# Altium project Robot Sensor Module.PrjPcb
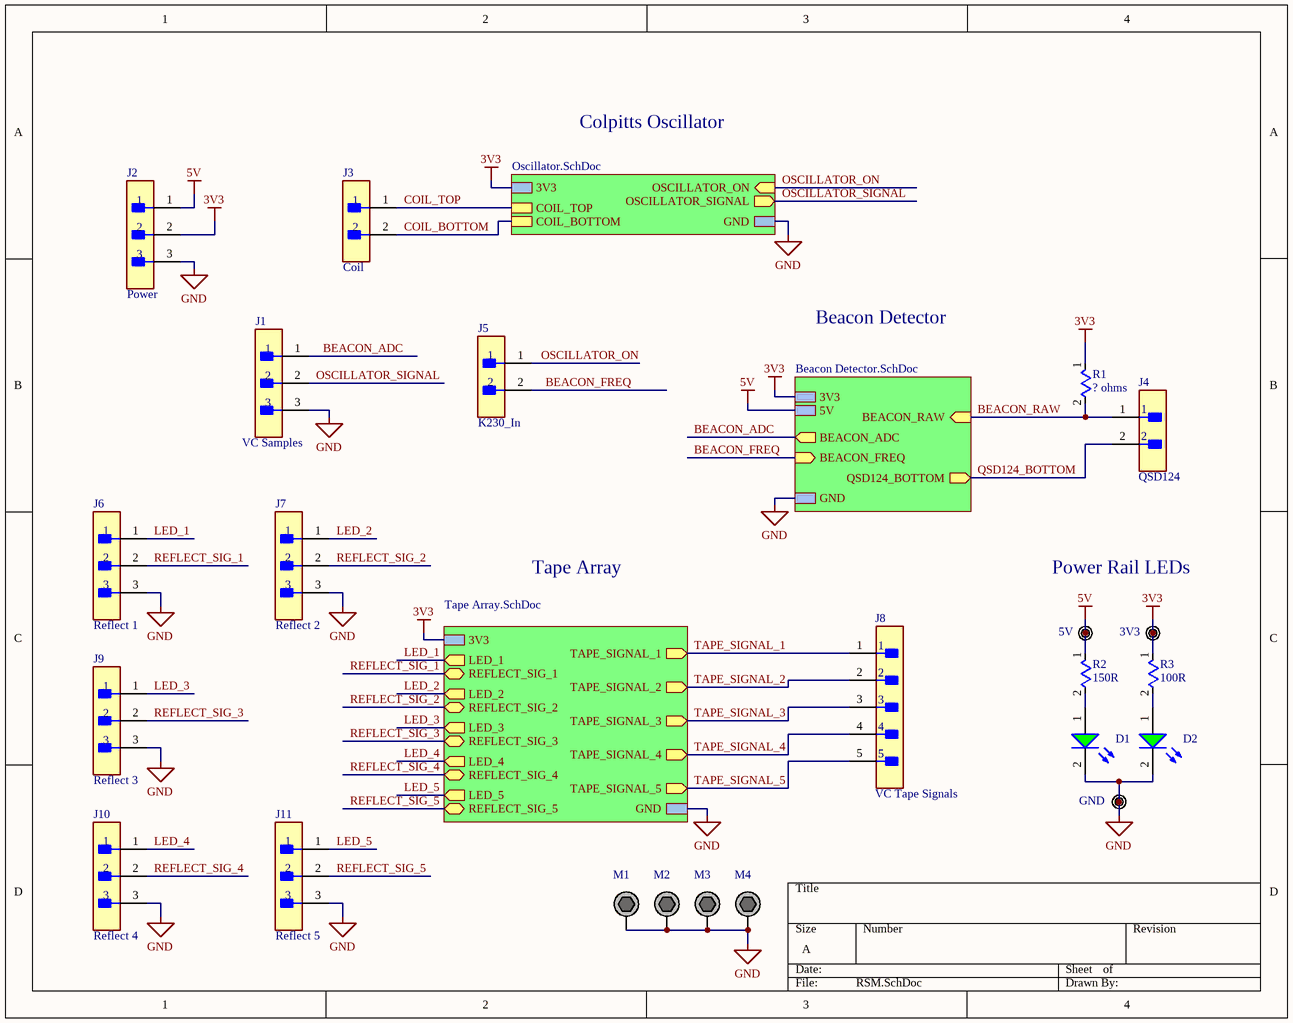
[diagram p0: RSM.SchDoc]
4 sheets, 74 parts. Net scope: hierarchical (ports join the sheet entries above them; power ports are global).
Board file: RSM_PCB.PcbDoc
Sheets:
  RSM.SchDoc
    Beacon Detector = Beacon Detector.SchDoc
    Designator = Tape Array.SchDoc
    Designator = Oscillator.SchDoc

## Sheet RSM.SchDoc
size A; SheetNumber: 1; SheetTotal: 4

### Parts
D1  151051VS04000  [WL-TMRC_D5.9H8.7]  (value not drawn)
D2  151051VS04000  [WL-TMRC_D5.9H8.7]  (value not drawn)
J1  VC Samples  [FP-B3B-XH-A_LF_SN-MFG]
J2  Power  [FP-B3B-XH-A_LF_SN-MFG]
J3  Coil  [FP-B2B-XH-A_LF_SN-MFG]
J4  QSD124  [FP-B2B-XH-A_LF_SN-MFG]
J5  K230_In  [FP-B2B-XH-A_LF_SN-MFG]
J6  Reflect 1  [FP-B3B-XH-A_LF_SN-MFG]
J7  Reflect 2  [FP-B3B-XH-A_LF_SN-MFG]
J8  VC Tape Signals  [FP-B5B-XH-AM_LF_SN-MFG]
J9  Reflect 3  [FP-B3B-XH-A_LF_SN-MFG]
J10  Reflect 4  [FP-B3B-XH-A_LF_SN-MFG]
J11  Reflect 5  [FP-B3B-XH-A_LF_SN-MFG]
M1  M3 Mounting Hole Plated  [M3 Screw Hole - Plated]  (value not drawn)  (no BOM)
M2  M3 Mounting Hole Plated  [M3 Screw Hole - Plated]  (value not drawn)  (no BOM)
M3  M3 Mounting Hole Plated  [M3 Screw Hole - Plated]  (value not drawn)  (no BOM)
M4  M3 Mounting Hole Plated  [M3 Screw Hole - Plated]  (value not drawn)  (no BOM)
R1  ? ohms  [Axial 0.5]
R2  150R  [Axial 0.5]
R3  100R  [Axial 0.5]
TP1  5V  [TESTPOINT]  (no BOM)
TP2  3V3  [TESTPOINT]  (no BOM)
TP3  GND  [TESTPOINT]  (no BOM)

### Sub-sheets
Beacon Detector = Beacon Detector.SchDoc: 3V3, BEACON_RAW (in), GND, BEACON_ADC (out), BEACON_FREQ (in), QSD124_BOTTOM (out), 5V
Designator = Tape Array.SchDoc: LED_1 (out), REFLECT_SIG_1 (bidir), LED_2 (out), REFLECT_SIG_2 (bidir), LED_3 (out), REFLECT_SIG_3 (bidir), LED_4 (out), REFLECT_SIG_4 (bidir), REFLECT_SIG_5 (bidir), LED_5 (out), 3V3, GND, TAPE_SIGNAL_5 (out), TAPE_SIGNAL_4 (out), TAPE_SIGNAL_3 (out), TAPE_SIGNAL_2 (out), TAPE_SIGNAL_1 (out)
Designator = Oscillator.SchDoc: 3V3, COIL_TOP, COIL_BOTTOM, OSCILLATOR_ON (in), OSCILLATOR_SIGNAL (out), GND

### Nets
3V3: J2.2 R1.1 R3.1 TP2.1(TP) ; sheet Beacon Detector/3V3, sheet Designator/3V3, sheet Designator/3V3
5V: J2.1 R2.1 TP1.1(TP) ; sheet Beacon Detector/5V
GND: D1.2(K) D2.2(K) J1.3 J2.3 J6.3 J7.3 J9.3 J10.3 J11.3 M1.1 M2.1 M3.1 M4.1 TP3.1(TP) ; sheet Beacon Detector/GND, sheet Designator/GND, sheet Designator/GND
QSD124_BOTTOM: J4.2 ; sheet Beacon Detector/QSD124_BOTTOM
BEACON_ADC: J1.1 ; sheet Beacon Detector/BEACON_ADC
BEACON_FREQ: J5.2 ; sheet Beacon Detector/BEACON_FREQ
BEACON_RAW: J4.1 R1.2 ; sheet Beacon Detector/BEACON_RAW
COIL_BOTTOM: J3.2 ; sheet Designator/COIL_BOTTOM
COIL_TOP: J3.1 ; sheet Designator/COIL_TOP
LED_1: J6.1 ; sheet Designator/LED_1
LED_2: J7.1 ; sheet Designator/LED_2
LED_3: J9.1 ; sheet Designator/LED_3
LED_4: J10.1 ; sheet Designator/LED_4
LED_5: J11.1 ; sheet Designator/LED_5
OSCILLATOR_ON: J5.1 ; sheet Designator/OSCILLATOR_ON
OSCILLATOR_SIGNAL: J1.2 ; sheet Designator/OSCILLATOR_SIGNAL
REFLECT_SIG_1: J6.2 ; sheet Designator/REFLECT_SIG_1
REFLECT_SIG_2: J7.2 ; sheet Designator/REFLECT_SIG_2
REFLECT_SIG_3: J9.2 ; sheet Designator/REFLECT_SIG_3
REFLECT_SIG_4: J10.2 ; sheet Designator/REFLECT_SIG_4
REFLECT_SIG_5: J11.2 ; sheet Designator/REFLECT_SIG_5
TAPE_SIGNAL_1: J8.1 ; sheet Designator/TAPE_SIGNAL_1
TAPE_SIGNAL_2: J8.2 ; sheet Designator/TAPE_SIGNAL_2
TAPE_SIGNAL_3: J8.3 ; sheet Designator/TAPE_SIGNAL_3
TAPE_SIGNAL_4: J8.4 ; sheet Designator/TAPE_SIGNAL_4
TAPE_SIGNAL_5: J8.5 ; sheet Designator/TAPE_SIGNAL_5
NetD1_1: D1.1(A) R2.2
NetD2_1: D2.1(A) R3.2

### Notes on the sheet
- Colpitts Oscillator
- Beacon Detector
- Tape Array
- Power Rail LEDs

### Library data of the parts
D1 D2 = CMP-1488-00007-2: NexarPartId: 29717814; Forward Voltage: 2.1V; Viewing Angle: 40°; Lens Size: 5mm; Luminous Intensity: 140mcd; Color: Green; Max Reverse Voltage (DC): 5V; Wavelength: 572nm; Forward Current: 100mA; Peak Wavelength: 573nm; Test Current: 20mA; Lens Style: Circular, Diffused, Round; REACH SVHC: Unknown; Height: 8.6mm; Mount: Through Hole; Width: 5mm; Length: 5mm; Min Operating Temperature: -40°C; RoHS: Compliant; Dominant Wavelength: 572nm; Case/Package: Radial; Max Operating Temperature: 85°C; Packaging: Bulk
J1 J2 J6 J7 J9-J11 = CMP-17439-000014-3: CONN HEADER VERT 3POS 2.5MM; Max Voltage Rating (DC): 250V; Number of Positions: 3; Current Rating: 3A; Gender: Male; Wire/Cable Gauge: 22AWG; Contact Resistance: 20mR; Insulation Resistance: 1GR; Insulation Material: Nylon; Contact Plating: Tin; Depth: 5.75mm; Contact Type: Male Pin; Max Operating Temperature: 85°C; Insulation Color: Natural; Voltage Rating (AC): 250V; Color: Natural; Connector Type: Header; Orientation: Straight; Fastening Type: Detent; Housing Color: White; Min Operating Temperature: -25°C; Termination: Solder; Voltage Rating: 250V; Series: XH; Pitch: 2.5mm; Contact Shape: Square; Number of Rows: 1; Lead Free: Lead Free; Packaging: Bulk; Mount: Through Hole; Flammability Rating: UL94 V-0; Max Voltage Rating (AC): 250V; REACH SVHC: No SVHC; Housing Material: Polyamide; Contact Material: Brass; Lead Pitch: 2.5mm; Contact Finish - Mating: TIN; Length: 9.9mm; Max Current Rating: 3A; Number of Contacts: 3
J3-J5 = CMP-2000-05888-3: CONN HEADER VERT 2POS 2.5MM; Current Rating: 3A; Voltage Rating: 250V; Number of Contacts: 2; Contact Resistance: 20mR; Wire/Cable Gauge: 22AWG; Insulation Resistance: 1GR; Connector Type: Male Pin; Packaging: Bulk; Contact Material: Brass; Lead Free: Lead Free; Orientation: Straight; Contact Plating: Tin; Max Current Rating: 3A; Termination: Solder; Fastening Type: Detent; Depth: 5.75mm; Housing Material: Polyamide; REACH SVHC: No SVHC; Series: XH; Voltage Rating (AC): 250V; Number of Positions: 2; Color: Natural; Contact Type: Male Pin; Max Voltage Rating (DC): 250V; Pitch: 2.5mm; Lead Pitch: 2.5mm; Mount: Through Hole; Max Operating Temperature: 85°C; Length: 7.4mm; Max Voltage Rating (AC): 250V; Min Operating Temperature: -25°C; Number of Rows: 1; Housing Color: White
J8 = CMP-17439-000304-1: CONN HEADER VERT 5POS 2.5MM; Mated Stacking Heights: 9.8mm; Voltage Rating: 250V; Max Current Rating: 3A; Number of Positions: 5; Contact Resistance: 20mR; Depth: 5.75mm; Connector Type: Header; Color: Green; Insulation Material: Nylon; Contact Plating: Copper; Length: 14.9mm; Fastening Type: Detent; Contact Material: Brass; Number of Rows: 1; Contact Type: Male Pin; Housing Material: Polyamide; Housing Color: White; Lead Free: Lead Free; Max Voltage Rating (AC): 250V; Mount: Through Hole; Contact Shape: Square; Min Operating Temperature: -25°C; Packaging: Bulk; Orientation: Straight; Insulation Color: Natural; Series: XH; Flammability Rating: UL94 V-0; Contact Finish - Mating: TIN; Max Operating Temperature: 85°C; Termination: Solder; Pitch: 2.5mm
M1-M4 = CMP-019-000000-3: Design Item ID: M3 Mounting Hole Plated; Source: UBC Formula Electric.SchLib
R1-R3 = RES_GENERIC
TP1-TP3 = CMP-020-0000-4: Source: UBC Formula Electric.SchLib; Design Item ID: Thru-Hole Test Point

## Sheet Beacon Detector.SchDoc
size A; SheetNumber: 3; SheetTotal: 4
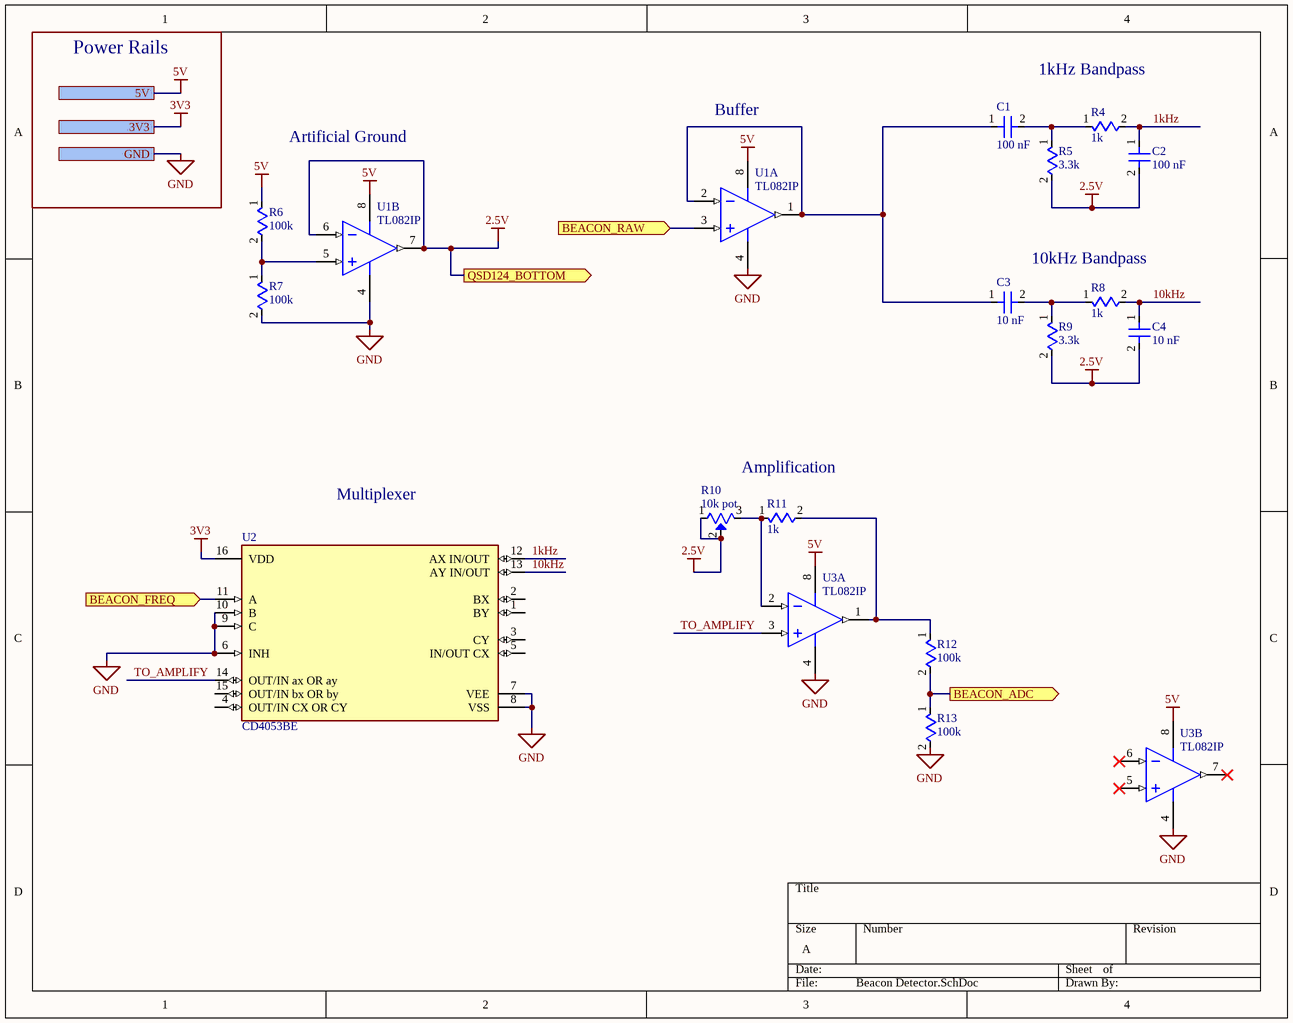
[diagram p1: Beacon Detector.SchDoc]

### Parts
C1  100 nF  [Generic small capacitor]
C2  100 nF  [Generic small capacitor]
C3  10 nF  [Generic small capacitor]
C4  10 nF  [Generic small capacitor]
R4  1k  [Axial 0.5]
R5  3.3k  [Axial 0.5]
R6  100k  [Axial 0.5]
R7  100k  [Axial 0.5]
R8  1k  [Axial 0.5]
R9  3.3k  [Axial 0.5]
R10  10k pot  [RES3_PV36W103C01B00_BRN]
R11  1k  [Axial 0.5]
R12  100k  [Axial 0.5]
R13  100k  [Axial 0.5]
U1  TL082IP  [P0008A]  (parts A,B of 2)
U2  CD4053BE  [FP-N0016A-MFG]
U3  TL082IP  [P0008A]  (parts A,B of 2)

### Ports
3V3 (see RSM[3B], Oscillator[1A]), 5V (see RSM[3B]), BEACON_ADC (out, see RSM[3B]), BEACON_FREQ (in, see RSM[3B]), BEACON_RAW (in, see RSM[4B]), GND (see RSM[3B], Oscillator[1A], Tape Array[1A]), QSD124_BOTTOM (out, see RSM[4B])

### Nets
2.5V: C2.2 C4.2 R5.2 R9.2 R10.1 R10.2 U1.6(IN2-) U1.7(OUT2) ; port QSD124_BOTTOM  [project net QSD124_BOTTOM]
3V3: U2.16(VDD) ; port 3V3
5V: R6.1 U1.8(VCC+) U3.8(VCC+) ; port 5V
GND: R7.2 R13.2 U1.4(VCC-) U2.6(INH) U2.7(VEE) U2.8(VSS) U2.9(C) U2.10(B) U3.4(VCC-) ; port GND
1kHz: C2.1 R4.2 U2.12(AX_IN/OUT)
10kHz: C4.1 R8.2 U2.13(AY_IN/OUT)
BEACON_ADC: R12.2 R13.1 ; port BEACON_ADC
BEACON_FREQ: U2.11(A) ; port BEACON_FREQ
BEACON_RAW: U1.3(IN1+) ; port BEACON_RAW
TO_AMPLIFY: U2.14(OUT/IN_ax_OR_ay) U3.3(IN1+)
NetC1_1: C1.1 C3.1 U1.1(OUT1) U1.2(IN1-)
NetC1_2: C1.2 R4.1 R5.1
NetC3_2: C3.2 R8.1 R9.1
NetR6_2: R6.2 R7.1 U1.5(IN2+)
NetR10_3: R10.3 R11.1 U3.2(IN1-)
NetR11_2: R11.2 R12.1 U3.1(OUT1)

Not connected (* = marked no-connect by the designer): U2 1(BY) 2(BX) 3(CY) 4(OUT/IN_CX_OR_CY) 5(IN/OUT_CX) 15(OUT/IN_bx_OR_by); U3 5(IN2+)* 6(IN2-)* 7(OUT2)*

### Notes on the sheet
- Power Rails
- 1kHz Bandpass
- Artificial Ground
- Buffer
- 10kHz Bandpass
- Multiplexer
- Amplification

### Library data of the parts
C1-C4 = CAP_GENERIC
R4-R9 R11-R13 = RES_GENERIC
R10 = Trimmer pot
U1 U3 = CMP-0017-01015-2: JFET-Input Operational Amplifier, 7 to 36 V, -40 to 85 degC, 8-pin DIP (P8), Pb-Free (RoHS); Manufacturer: Texas Instruments; Total Supply Voltage(Max)(+5V is 5, +/-5V is 10): 36; Number of Channels: 2; GBW(Typ)(MHz): 3; Vio (25C)(Max)(mV): 6; Offset Drift(Typ)(uV/C): 18; Slew Rate(Typ)(V/us): 13; Total Supply Voltage(Min)(+5V is 5, +/-5V is 10): 7; CMRR(Min)(dB): 75; Iq per channel(Max)(mA): 2.8; IIB(Max)(pA): 200; Sub Family: General Purpose Amplifier, High Supply Voltage Amplifier (>=30V); Rating: Catalog; ComponentLink1Description: Manufacturer URL; Code_JEDEC: MS-001; Eco-Plan: Pb-Free (RoHS); ComponentLink2Description: Datasheet; PackageReference: P0008A; ComponentLink3Description: Package Specification; ComponentLink1URL: http://www.ti.com/; PackageDescription: 8-Pin Plastic In-Line, Body 9.59 x 6.35 mm, Pitch 2.54 mm; Vn at 1kHz(Typ)(nV/rtHz): 18; PackageVersion: 4040082/E, 04/2010; ComponentLink3URL: http://www.ti.com/litv/pdf/mpdi001b; DatasheetVersion: SLOS081G; PartNumber: TL082IP; Mounting Technology: Through Hole; ComponentLink2URL: http://www.ti.com/lit/ds/symlink/tl082.pdf
U2 = CMP-1575-00068-4: IC MUX/DEMUX TRIPLE 2X1 16DIP; Polarity: Non-Inverting; Quiescent Current: 80nA; Logic Function: Mux; Number of Channels: 3; Throw Configuration: SPDT; Turn-Off Delay Time: 450ns; Number of Terminals/Pins: 16; Max Dual Supply Voltage: 9V; On-State Resistance: 240R; Number of Inputs: 6; Min Supply Voltage: 3V; Min Dual Supply Voltage: 2.5V; Propagation Delay: 60ns; Turn-On Delay Time: 720ns; Max Supply Voltage: 20V; Bandwidth: 30MHz; Supply Type: Single; Operating Supply Voltage: 18V; Mount: Through Hole; Weight: 0.03357oz; Contact Plating: Gold; Number of Pins: 16; Width: 7.62mm; Number of Outputs: 3; Number of Circuits: 3; Max Operating Temperature: 125°C; Min Operating Temperature: -55°C; Packaging: Rail/Tube; RoHS Compliant: Yes; Max Input Voltage: 20V; Radiation Hardening: No; Case/Package: PDIP; Operating Supply Current: 80nA; Package Quantity: 25; REACH SVHC: No SVHC; Nominal Supply Current: 80nA; Lead Free: Lead Free

## Sheet Tape Array.SchDoc
size A; SheetNumber: 2; SheetTotal: 4
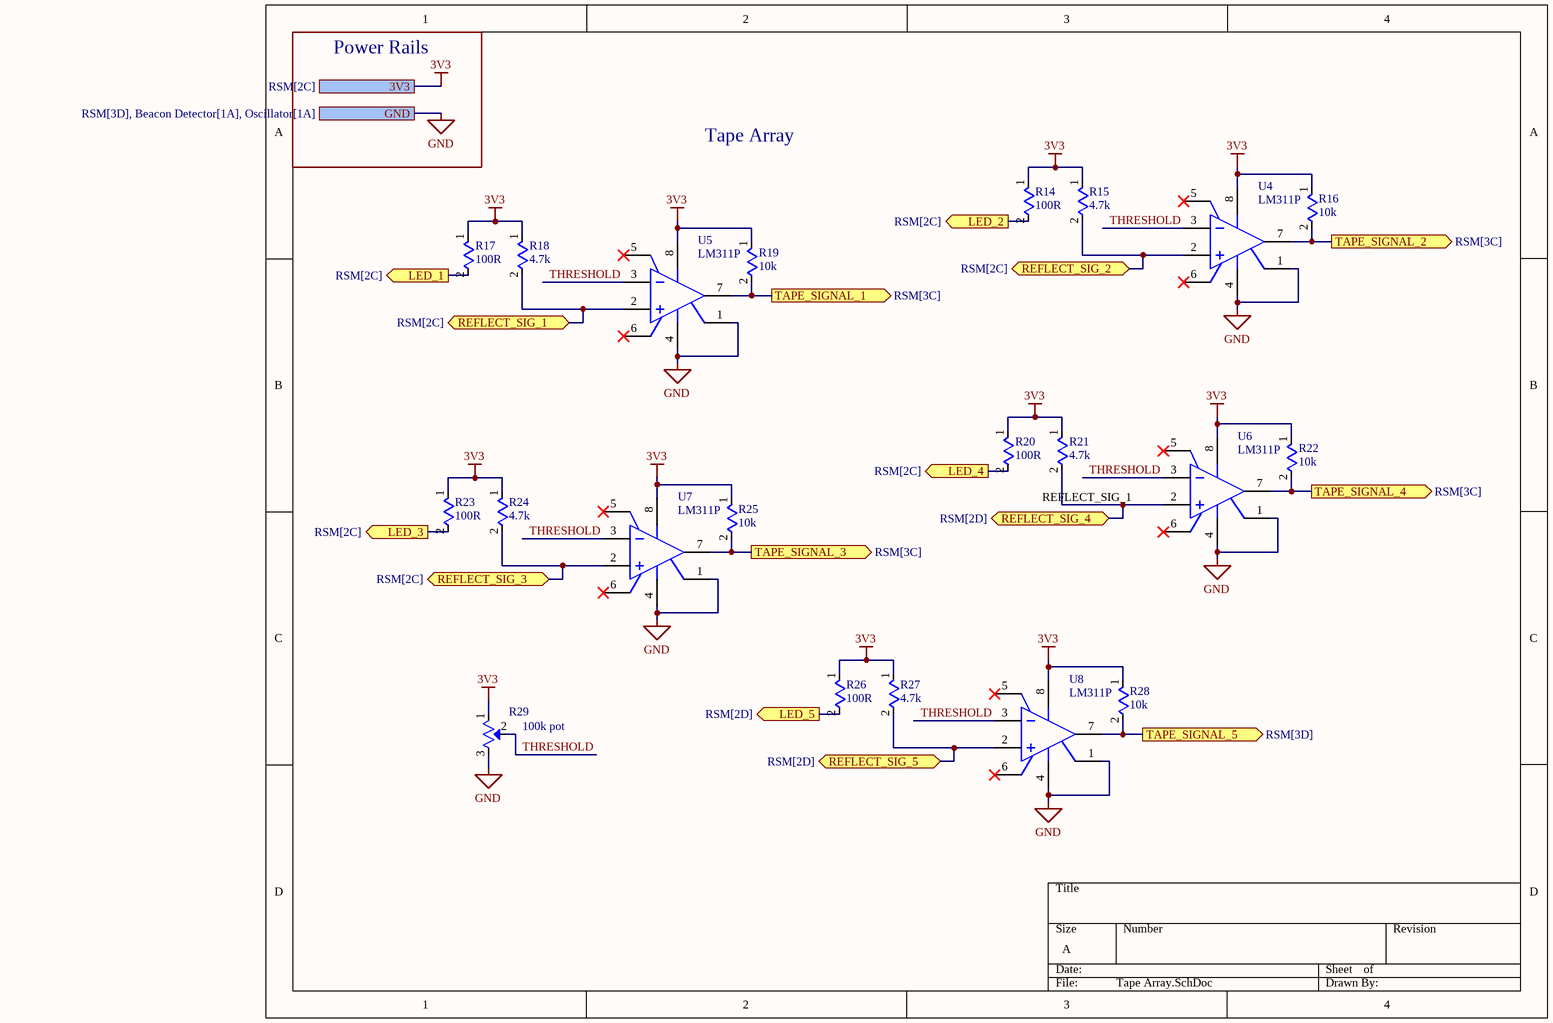
[diagram p2: Tape Array.SchDoc]

### Parts
R14  100R  [Axial 0.5]
R15  4.7k  [Axial 0.5]
R16  10k  [Axial 0.5]
R17  100R  [Axial 0.5]
R18  4.7k  [Axial 0.5]
R19  10k  [Axial 0.5]
R20  100R  [Axial 0.5]
R21  4.7k  [Axial 0.5]
R22  10k  [Axial 0.5]
R23  100R  [Axial 0.5]
R24  4.7k  [Axial 0.5]
R25  10k  [Axial 0.5]
R26  100R  [Axial 0.5]
R27  4.7k  [Axial 0.5]
R28  10k  [Axial 0.5]
R29  100k pot  [RES3_PV36W103C01B00_BRN]
U4  LM311P  [FP-P0008A-MFG]
U5  LM311P  [FP-P0008A-MFG]
U6  LM311P  [FP-P0008A-MFG]
U7  LM311P  [FP-P0008A-MFG]
U8  LM311P  [FP-P0008A-MFG]

### Ports
3V3 (see RSM[2C]), GND (see RSM[3D], Beacon Detector[1A], Oscillator[1A]), LED_1 (out, see RSM[2C]), LED_2 (out, see RSM[2C]), LED_3 (out, see RSM[2C]), LED_4 (out, see RSM[2C]), LED_5 (out, see RSM[2D]), REFLECT_SIG_1 (bidir, see RSM[2C]), REFLECT_SIG_2 (bidir, see RSM[2C]), REFLECT_SIG_3 (bidir, see RSM[2C]), REFLECT_SIG_4 (bidir, see RSM[2D]), REFLECT_SIG_5 (bidir, see RSM[2D]), TAPE_SIGNAL_1 (out, see RSM[3C]), TAPE_SIGNAL_2 (out, see RSM[3C]), TAPE_SIGNAL_3 (out, see RSM[3C]), TAPE_SIGNAL_4 (out, see RSM[3C]), TAPE_SIGNAL_5 (out, see RSM[3D])

### Nets
3V3: R14.1 R15.1 R16.1 R17.1 R18.1 R19.1 R20.1 R21.1 R22.1 R23.1 R24.1 R25.1 R26.1 R27.1 R28.1 R29.1 U4.8(VCC+) U5.8(VCC+) U6.8(VCC+) U7.8(VCC+) U8.8(VCC+) ; port 3V3
GND: R29.3 U4.1(EMIT_OUT) U4.4(VCC-) U5.1(EMIT_OUT) U5.4(VCC-) U6.1(EMIT_OUT) U6.4(VCC-) U7.1(EMIT_OUT) U7.4(VCC-) U8.1(EMIT_OUT) U8.4(VCC-) ; port GND
LED_1: R17.2 ; port LED_1
LED_2: R14.2 ; port LED_2
LED_3: R23.2 ; port LED_3
LED_4: R20.2 ; port LED_4
LED_5: R26.2 ; port LED_5
REFLECT_SIG_1: R18.2 U5.2(IN+) ; port REFLECT_SIG_1
REFLECT_SIG_2: R15.2 U4.2(IN+) ; port REFLECT_SIG_2
REFLECT_SIG_3: R24.2 U7.2(IN+) ; port REFLECT_SIG_3
REFLECT_SIG_4: R21.2 U6.2(IN+) ; port REFLECT_SIG_4
REFLECT_SIG_5: R27.2 U8.2(IN+) ; port REFLECT_SIG_5
TAPE_SIGNAL_1: R19.2 U5.7(COL_OUT) ; port TAPE_SIGNAL_1
TAPE_SIGNAL_2: R16.2 U4.7(COL_OUT) ; port TAPE_SIGNAL_2
TAPE_SIGNAL_3: R25.2 U7.7(COL_OUT) ; port TAPE_SIGNAL_3
TAPE_SIGNAL_4: R22.2 U6.7(COL_OUT) ; port TAPE_SIGNAL_4
TAPE_SIGNAL_5: R28.2 U8.7(COL_OUT) ; port TAPE_SIGNAL_5
THRESHOLD: R29.2 U4.3(IN-) U5.3(IN-) U6.3(IN-) U7.3(IN-) U8.3(IN-)

Not connected (* = marked no-connect by the designer): U4 5(BALANCE)* 6(BAL/STRB)*; U5 5(BALANCE)* 6(BAL/STRB)*; U6 5(BALANCE)* 6(BAL/STRB)*; U7 5(BALANCE)* 6(BAL/STRB)*; U8 5(BALANCE)* 6(BAL/STRB)*

### Notes on the sheet
- Power Rails
- Tape Array
- (near R21) REFLECT_SIG_1

### Library data of the parts
R14-R28 = RES_GENERIC
R29 = Trimmer pot
U4-U8 = CMP-1685-00016-2: Manufacturer Lifecycle Status: ACTIVE; NexarPartId: 24336; Output Type: TTL; Max Output Voltage: 7.5mV; Min Supply Voltage: 3.5V; Min Dual Supply Voltage: 1.75V; Max Supply Current: 7.5mA; Number of Elements: 1; Response Time: 165ns; Max Dual Supply Voltage: 15V; Max Supply Voltage: 30V; Max Junction Temperature (Tj): 150°C; Max Power Dissipation: 500mW; Input Offset Voltage (Vos): 2mV; Resistance: 390Ω; Operating Supply Voltage: 28V; Power Rating: 100mW; Dual Supply Voltage: 9V; Output Current per Channel: 50mA; Turn-On Delay Time: 115ns; Tolerance: 1%; Voltage Gain: 106.02dB; Input Bias Current: 250nA; Voltage Rating: 75V; Contact Plating: Gold; Case Code (Imperial): 0603; Number of Circuits: 1; Lifecycle Status: Production; Ambient Temperature Range High: 70°C; Radiation Hardening: No; Quiescent Current: 7.5mA; Number of Channels: 1; Max Operating Temperature: 70°C; Height: 5.08mm; Type: General Purpose; Case Code (Metric): 1608; Mount: Surface Mount, Through Hole; Case/Package: PDIP; Thickness: 3.9mm; REACH SVHC: No SVHC; Length: 9.81mm; RoHS: Compliant; Schedule B: 8542390000, 8542390000; Lead Free: Lead Free; Min Operating Temperature: 0°C; Width: 6.35mm; Output Current: 50mA; Packaging: Tape and Reel; Nominal Supply Current: 7.5mA; Weight: 2.012816mg; Propagation Delay: 115ns; Max Input Current: 250nA; Number of Pins: 8

## Sheet Oscillator.SchDoc
size A; SheetNumber: 4; SheetTotal: 4
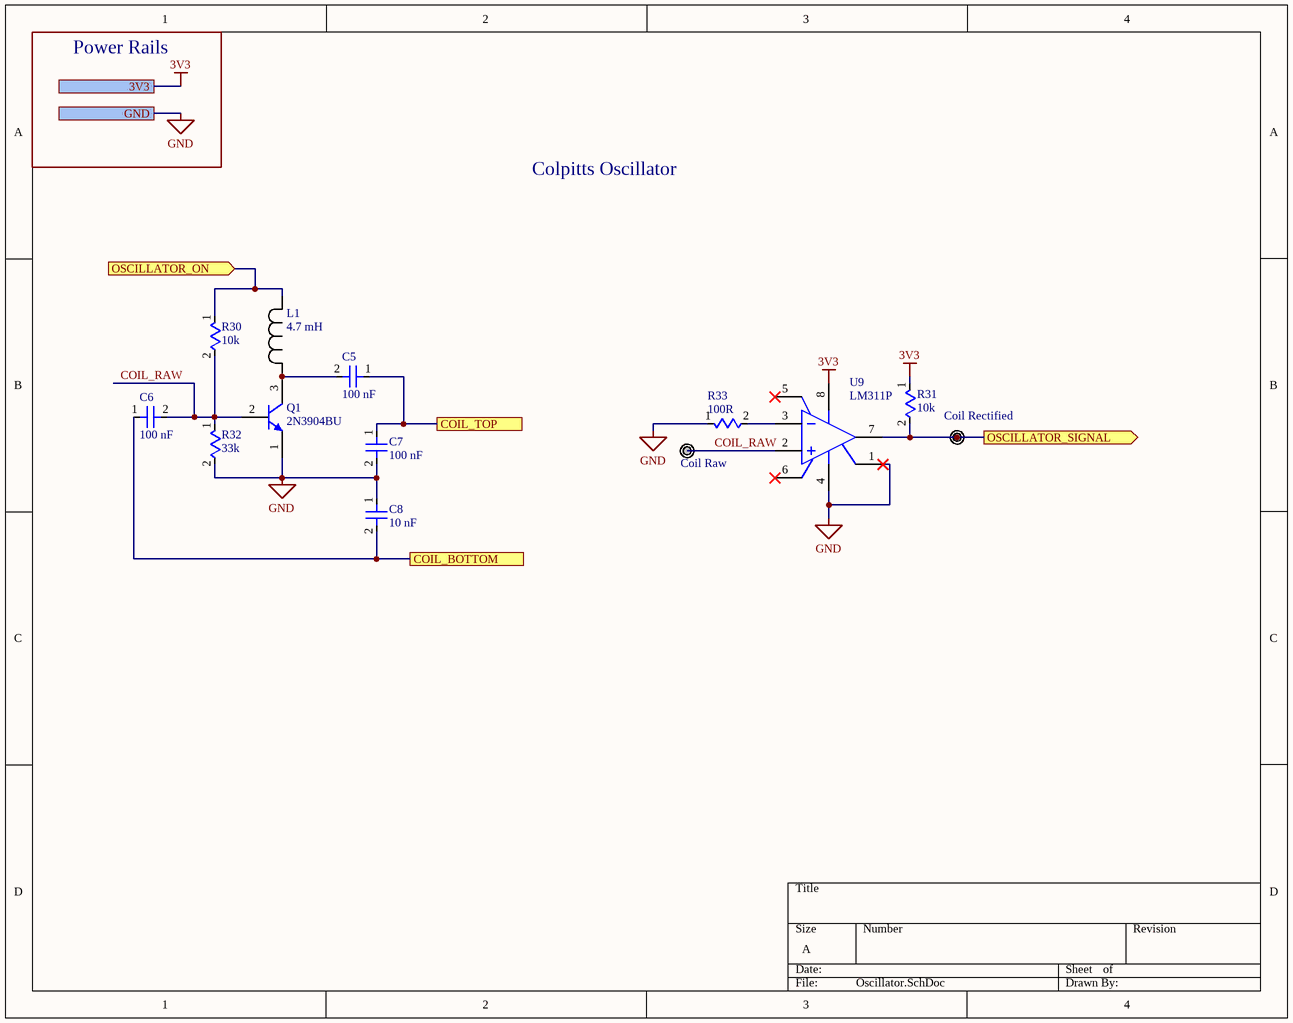
[diagram p3: Oscillator.SchDoc]

### Parts
C5  100 nF  [Generic small capacitor]
C6  100 nF  [Generic small capacitor]
C7  100 nF  [Generic small capacitor]
C8  10 nF  [Generic small capacitor]
L1  4.7 mH  [IND_BOURNS_RLB1014]
Q1  2N3904BU  [2n3904]
R30  10k  [Axial 0.5]
R31  10k  [Axial 0.5]
R32  33k  [Axial 0.5]
R33  100R  [Axial 0.5]
TP4  Coil Rectified  [TESTPOINT]  (no BOM)
TP5  Coil Raw  [TESTPOINT]  (no BOM)
U9  LM311P  [FP-P0008A-MFG]

### Ports
3V3 (see RSM[2A], Beacon Detector[1A], Tape Array[1A]), COIL_BOTTOM (see RSM[2A]), COIL_TOP (see RSM[2A]), GND (see RSM[3A], Beacon Detector[1A], Tape Array[1A]), OSCILLATOR_ON (in, see RSM[3A]), OSCILLATOR_SIGNAL (out, see RSM[3A])

### Nets
3V3: R31.1 U9.8(VCC+) ; port 3V3
GND: C7.2 C8.1 Q1.1(E) R32.2 R33.1 U9.1(EMIT_OUT) U9.4(VCC-) ; port GND
COIL_BOTTOM: C6.1 C8.2 ; port COIL_BOTTOM
COIL_RAW: C6.2 Q1.2(B) R30.2 R32.1 TP5.1(TP) U9.2(IN+)
COIL_TOP: C5.1 C7.1 ; port COIL_TOP
OSCILLATOR_ON: L1.1 R30.1 ; port OSCILLATOR_ON
OSCILLATOR_SIGNAL: R31.2 TP4.1(TP) U9.7(COL_OUT) ; port OSCILLATOR_SIGNAL
NetC5_2: C5.2 L1.2 Q1.3(C)
NetR33_2: R33.2 U9.3(IN-)

Not connected (* = marked no-connect by the designer): U9 5(BALANCE)* 6(BAL/STRB)*

### Notes on the sheet
- Power Rails
- Colpitts Oscillator

### Library data of the parts
C5-C8 = CAP_GENERIC
L1 = RLB1014-472KL: No Description Available; Manufacturer_Name: Bourns Electronics; Copyright: Copyright (C) 2026 Ultra Librarian. All rights reserved.; Manufacturer_Part_Number: RLB1014-472KL
Q1 = 2n3904: NPN General-Purpose Amplifier, 40 V VCEO, 0.2 A, -55 to 150 degC, 2-Pin TO-92, RoHS, Bulk; Manufacturer: FairchildSemiconductor; Maximum Collector Base Voltage: 60V; Minimum DC Current Gain: 40@0.1mA@1V; Maximum Collector Emitter Voltage: 40V; Maximum DC Collector Current: 0.2A; Rad Hard: No; Maximum Operating Frequency: 300(Min)MHz; Maximum Collector Emitter Saturation Voltage: 0.2@1mA@10mA; Maximum Power Dissipation: 625mW; Package Description: 3-Pin Transistor Outline Package, Body Dia 4.79 mm, Pitch 1.27 mm; Package Reference: TO-92; Pin Count: 3; Operating Temperature: -55to150degC; Category: GPBJT; Manufacturer URL: https://www.fairchildsemi.com/; Datasheet URL: https://datasheet.ciiva.com/4722/2n3904-82270-4722369.pdf; Package: 3TO-92; Packaging: Bulk; Type: NPN; Datasheet Version: Rev. 1.1.0, 10/2014; Mounting: ThroughHole
R30-R33 = RES_GENERIC
TP4 TP5 = CMP-020-0000-4: Source: UBC Formula Electric.SchLib; Design Item ID: Thru-Hole Test Point
U9 = CMP-1685-00016-2: as U4 on sheet Tape Array; Contact Plating: Gold; Case Code (Imperial): 0603; Number of Circuits: 1; Lifecycle Status: Production; Ambient Temperature Range High: 70°C; Radiation Hardening: No; Quiescent Current: 7.5mA; Number of Channels: 1; Max Operating Temperature: 70°C; Height: 5.08mm; Type: General Purpose; Case Code (Metric): 1608; Mount: Surface Mount, Through Hole; Case/Package: PDIP; Thickness: 3.9mm; REACH SVHC: No SVHC; Length: 9.81mm; RoHS: Compliant; Schedule B: 8542390000, 8542390000; Lead Free: Lead Free; Min Operating Temperature: 0°C; Width: 6.35mm; Output Current: 50mA; Packaging: Tape and Reel; Nominal Supply Current: 7.5mA; Weight: 2.012816mg; Propagation Delay: 115ns; Max Input Current: 250nA; Number of Pins: 8

## Nets that join several sheets
3V3: RSM (J2.2 R1.1 R3.1 TP2.1), Beacon Detector (U2.16), Tape Array (21 pins), Oscillator (R31.1 U9.8)
5V: RSM (J2.1 R2.1 TP1.1), Beacon Detector (R6.1 U1.8 U3.8)
GND: RSM (14 pins), Beacon Detector (9 pins), Tape Array (11 pins), Oscillator (7 pins)
QSD124_BOTTOM: RSM (J4.2), Beacon Detector (8 pins)
BEACON_ADC: RSM (J1.1), Beacon Detector (R12.2 R13.1)
BEACON_FREQ: RSM (J5.2), Beacon Detector (U2.11)
BEACON_RAW: RSM (J4.1 R1.2), Beacon Detector (U1.3)
COIL_BOTTOM: RSM (J3.2), Oscillator (C6.1 C8.2)
COIL_TOP: RSM (J3.1), Oscillator (C5.1 C7.1)
LED_1: RSM (J6.1), Tape Array (R17.2)
LED_2: RSM (J7.1), Tape Array (R14.2)
LED_3: RSM (J9.1), Tape Array (R23.2)
LED_4: RSM (J10.1), Tape Array (R20.2)
LED_5: RSM (J11.1), Tape Array (R26.2)
OSCILLATOR_ON: RSM (J5.1), Oscillator (L1.1 R30.1)
OSCILLATOR_SIGNAL: RSM (J1.2), Oscillator (R31.2 TP4.1 U9.7)
REFLECT_SIG_1: RSM (J6.2), Tape Array (R18.2 U5.2)
REFLECT_SIG_2: RSM (J7.2), Tape Array (R15.2 U4.2)
REFLECT_SIG_3: RSM (J9.2), Tape Array (R24.2 U7.2)
REFLECT_SIG_4: RSM (J10.2), Tape Array (R21.2 U6.2)
REFLECT_SIG_5: RSM (J11.2), Tape Array (R27.2 U8.2)
TAPE_SIGNAL_1: RSM (J8.1), Tape Array (R19.2 U5.7)
TAPE_SIGNAL_2: RSM (J8.2), Tape Array (R16.2 U4.7)
TAPE_SIGNAL_3: RSM (J8.3), Tape Array (R25.2 U7.7)
TAPE_SIGNAL_4: RSM (J8.4), Tape Array (R22.2 U6.7)
TAPE_SIGNAL_5: RSM (J8.5), Tape Array (R28.2 U8.7)